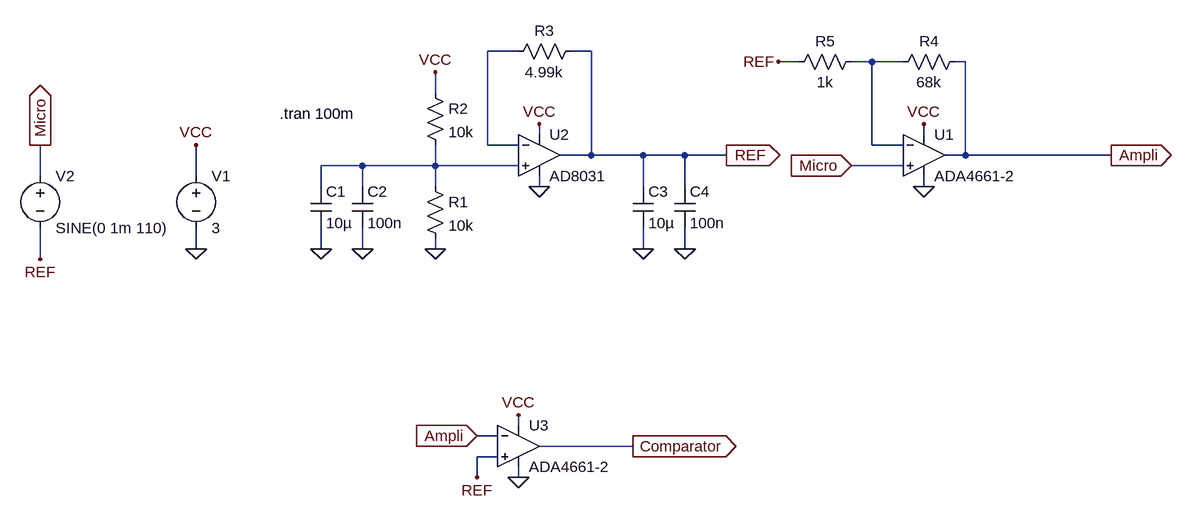
[diagram p0: schematic guiitar-Tuner.asc]
guiitar-Tuner.asc, the LTspice schematic file:
Version 4.1
SHEET 1 1832 728
WIRE 352 -16 304 -16
WIRE 464 -16 432 -16
WIRE 784 0 752 0
WIRE 896 0 864 0
WIRE 944 0 896 0
WIRE 1040 0 1024 0
WIRE 224 48 224 16
WIRE 384 112 384 96
WIRE 976 112 976 96
WIRE 304 128 304 -16
WIRE 352 128 304 128
WIRE 896 128 896 0
WIRE 944 128 896 128
WIRE 464 144 464 -16
WIRE 464 144 416 144
WIRE 544 144 464 144
WIRE 608 144 544 144
WIRE 672 144 608 144
WIRE 1040 144 1040 0
WIRE 1040 144 1008 144
WIRE 1264 144 1040 144
WIRE 112 160 48 160
WIRE 224 160 224 128
WIRE 224 160 112 160
WIRE 352 160 224 160
WIRE 944 160 864 160
WIRE -384 176 -384 128
WIRE -144 176 -144 128
WIRE 48 192 48 160
WIRE 112 192 112 160
WIRE 224 192 224 160
WIRE 384 192 384 176
WIRE 544 192 544 144
WIRE 608 192 608 144
WIRE 976 192 976 176
WIRE -144 288 -144 256
WIRE 48 288 48 256
WIRE 112 288 112 256
WIRE 224 288 224 272
WIRE 544 288 544 256
WIRE 608 288 608 256
WIRE -384 304 -384 256
WIRE 352 560 352 544
WIRE 320 576 288 576
WIRE 528 592 384 592
WIRE 320 608 288 608
WIRE 288 640 288 608
WIRE 352 640 352 624
FLAG 672 144 REF
IOPIN 672 144 Out
FLAG 48 288 0
FLAG 112 288 0
FLAG 224 288 0
FLAG 544 288 0
FLAG 608 288 0
FLAG -144 288 0
FLAG -144 128 VCC
FLAG 224 16 VCC
FLAG 384 192 0
FLAG 384 96 VCC
FLAG 976 96 VCC
FLAG 864 160 Micro
IOPIN 864 160 In
FLAG 1264 144 Ampli
IOPIN 1264 144 Out
FLAG 752 0 REF
FLAG -384 304 REF
FLAG -384 128 Micro
IOPIN -384 128 Out
FLAG 976 192 0
FLAG 352 640 0
FLAG 352 544 VCC
FLAG 288 640 REF
FLAG 288 576 Ampli
IOPIN 288 576 In
FLAG 528 592 Comparator
IOPIN 528 592 Out
SYMBOL cap 32 192 R0
SYMATTR InstName C1
SYMATTR Value 10µ
SYMBOL cap 96 192 R0
SYMATTR InstName C2
SYMATTR Value 100n
SYMBOL res 208 176 R0
SYMATTR InstName R1
SYMATTR Value 10k
SYMBOL res 208 32 R0
SYMATTR InstName R2
SYMATTR Value 10k
SYMBOL OpAmps\\ADA4661-2 976 80 R0
SYMATTR InstName U1
SYMBOL OpAmps\\AD8031 384 80 R0
SYMATTR InstName U2
SYMBOL res 448 -32 R90
WINDOW 0 0 56 VBottom 2
WINDOW 3 32 56 VTop 2
SYMATTR InstName R3
SYMATTR Value 4.99k
SYMBOL cap 528 192 R0
SYMATTR InstName C3
SYMATTR Value 10µ
SYMBOL cap 592 192 R0
SYMATTR InstName C4
SYMATTR Value 100n
SYMBOL voltage -144 160 R0
WINDOW 123 0 0 Left 0
WINDOW 39 0 0 Left 0
SYMATTR InstName V1
SYMATTR Value 3
SYMBOL res 1040 -16 R90
WINDOW 0 0 56 VBottom 2
WINDOW 3 32 56 VTop 2
SYMATTR InstName R4
SYMATTR Value 68k
SYMBOL res 880 -16 R90
WINDOW 0 0 56 VBottom 2
WINDOW 3 32 56 VTop 2
SYMATTR InstName R5
SYMATTR Value 1k
SYMBOL voltage -384 160 R0
WINDOW 123 0 0 Left 0
WINDOW 39 0 0 Left 0
SYMATTR InstName V2
SYMATTR Value SINE(0 1m 110)
SYMBOL OpAmps\\ADA4661-2 352 528 R0
SYMATTR InstName U3
TEXT -16 80 Left 2 !.tran 100m

The netlist it stands for:
* guiitar-Tuner.asc
C1 N003 0 10µ
C2 N003 0 100n
R1 N003 0 10k
R2 VCC N003 10k
X§U1 Micro N002 VCC 0 Ampli ADA4661-2  ; pins In+ In- V+ V- OUT
X§U2 N003 N001 VCC 0 REF AD8031  ; pins In+ In- V+ V- OUT
R3 REF N001 4.99k
C3 REF 0 10µ
C4 REF 0 100n
V1 VCC 0 3
R4 Ampli N002 68k
R5 N002 REF 1k
V2 Micro REF SINE(0 1m 110)
X§U3 REF Ampli VCC 0 Comparator ADA4661-2  ; pins In+ In- V+ V- OUT
.tran 100m
.lib ADI1.lib
.backanno
.end